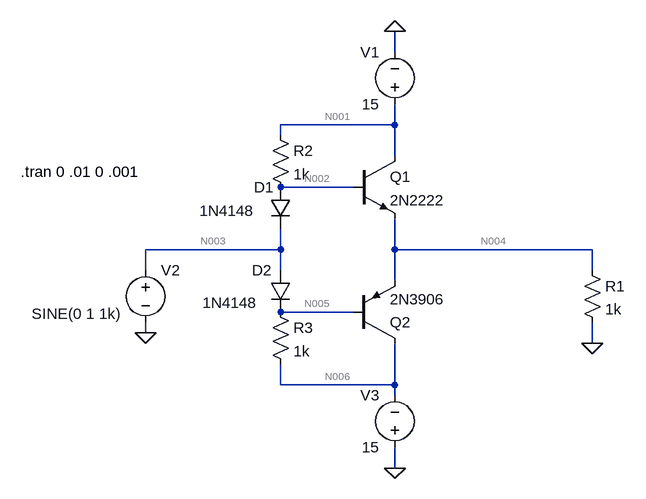
[diagram p0: schematic Draft5.asc]
Draft5.asc, the LTspice schematic file:
Version 4.1
SHEET 1 880 680
WIRE 208 -176 208 -208
WIRE 208 -64 208 -96
WIRE 208 -64 32 -64
WIRE 32 -48 32 -64
WIRE 208 -16 208 -64
WIRE 144 32 32 32
WIRE 32 128 32 96
WIRE 32 128 -176 128
WIRE 208 128 208 80
WIRE 512 128 208 128
WIRE -176 160 -176 128
WIRE 32 160 32 128
WIRE 512 160 512 128
WIRE 208 176 208 128
WIRE 144 224 32 224
WIRE -176 256 -176 240
WIRE 512 272 512 240
WIRE 32 336 32 304
WIRE 208 336 208 272
WIRE 208 336 32 336
WIRE 208 352 208 336
WIRE 208 464 208 432
FLAG 512 272 0
FLAG 208 -208 0
FLAG -176 256 0
FLAG 208 464 0
SYMBOL npn 144 -16 R0
SYMATTR InstName Q1
SYMATTR Value 2N2222
SYMBOL res 496 144 R0
SYMATTR InstName R1
SYMATTR Value 1k
SYMBOL voltage 208 -80 R180
WINDOW 0 24 96 Left 2
WINDOW 3 24 16 Left 2
WINDOW 123 0 0 Left 0
WINDOW 39 0 0 Left 0
SYMATTR InstName V1
SYMATTR Value 15
SYMBOL voltage -176 144 R0
WINDOW 3 -175 83 Left 2
WINDOW 123 0 0 Left 0
WINDOW 39 0 0 Left 0
SYMATTR InstName V2
SYMATTR Value SINE(0 1 1k)
SYMBOL pnp 144 272 M180
SYMATTR InstName Q2
SYMATTR Value 2N3906
SYMBOL voltage 208 448 R180
WINDOW 0 24 96 Left 2
WINDOW 3 24 16 Left 2
WINDOW 123 0 0 Left 0
WINDOW 39 0 0 Left 0
SYMATTR InstName V3
SYMATTR Value 15
SYMBOL diode 16 32 R0
WINDOW 0 -25 0 Left 2
WINDOW 3 -109 36 Left 2
SYMATTR InstName D1
SYMATTR Value 1N4148
SYMBOL diode 16 160 R0
WINDOW 0 -28 0 Left 2
WINDOW 3 -104 50 Left 2
SYMATTR InstName D2
SYMATTR Value 1N4148
SYMBOL res 16 -64 R0
SYMATTR InstName R2
SYMATTR Value 1k
SYMBOL res 16 208 R0
SYMATTR InstName R3
SYMATTR Value 1k
TEXT -368 8 Left 2 !.tran 0 .01 0 .001

The netlist it stands for:
* Draft5.asc
Q1 N001 N002 N004 0 2N2222
R1 N004 0 1k
V1 N001 0 15
V2 N003 0 SINE(0 1 1k)
Q2 N006 N005 N004 0 2N3906
V3 0 N006 15
D1 N002 N003 1N4148
D2 N003 N005 1N4148
R2 N001 N002 1k
R3 N005 N006 1k
.model D D
.lib standard.dio
.model NPN NPN
.model PNP PNP
.lib standard.bjt
.tran 0 .01 0 .001
.backanno
.end

* Results of the author's LTspice run, read from the files saved beside the schematic
* Operating Point, zero values left out:
*   V(n002) = 712.6 mV
*   V(n006) = -15 V
*   V(n001) = 15 V
*   V(n004) = -354.4 µV
*   V(n005) = -712.6 mV
*   Ic(Q1) = 9.518 mA
*   Ib(Q1) = 42.8 µA
*   Ie(Q1) = -9.561 mA
*   I(V1) = -23.81 mA
*   Ic(Q2) = -9.519 mA
*   Ib(Q2) = -42.51 µA
*   Ie(Q2) = 9.561 mA
*   I(V3) = -23.81 mA
*   I(D2) = 14.24 mA
*   I(R2) = 14.29 mA
*   I(R3) = 14.29 mA
*   I(R1) = -354.4 nA
*   I(V2) = -285.9 nA
*   I(D1) = 14.24 mA
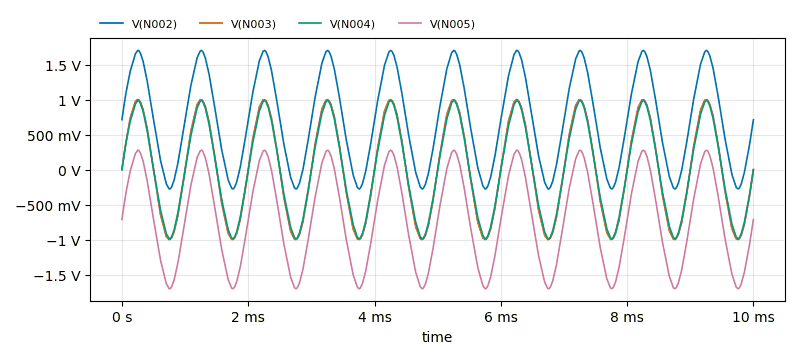
[diagram p1: Transient Analysis of Draft5.asc, plotted from the saved traces]
* Transient Analysis, 1 run:
*   V(N002): min -277.8 mV, max 1.703 V, average 713.1 mV, rms 992.3 mV, last 712.6 mV
*   V(N003): min -999.9 mV, max 1 V, average 132.2 µV, rms 718.8 mV, last 0 V
*   V(N004): min -989 mV, max 988.3 mV, average 133.3 µV, rms 688.9 mV, last -354.3 µV
*   V(N005): min -1.703 V, max 277.8 mV, average -712.1 mV, rms 991.6 mV, last -712.6 mV